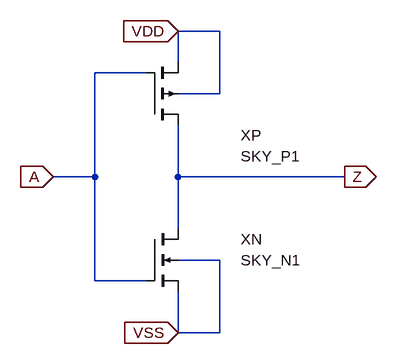
[diagram p0: schematic CMOS_INV.asc]
CMOS_INV.asc, the LTspice schematic file:
Version 4.1
SHEET 1 960 704
WIRE 352 192 352 272
WIRE 352 272 352 352
WIRE 352 272 608 272
WIRE 304 112 224 112
WIRE 224 112 224 272
WIRE 224 272 224 432
WIRE 224 432 304 432
WIRE 224 272 160 272
WIRE 352 96 352 48
WIRE 352 144 416 144
WIRE 416 144 416 48
WIRE 416 48 352 48
WIRE 352 448 352 512
WIRE 352 400 416 400
WIRE 416 400 416 512
WIRE 416 512 352 512
FLAG 608 272 Z
IOPIN 608 272 Out
FLAG 160 272 A
IOPIN 160 272 In
FLAG 352 48 VDD
IOPIN 352 48 In
FLAG 352 512 VSS
IOPIN 352 512 In
SYMBOL pmos4 304 192 M180
WINDOW 0 144 -16 Left 2
WINDOW 3 144 -48 Left 2
SYMATTR InstName XP
SYMATTR Value SKY_P1
SYMATTR SpiceLine w=1 l=0.15 mult=2
SYMATTR Prefix X
SYMBOL nmos4 304 352 R0
WINDOW 0 144 16 Left 2
WINDOW 3 144 48 Left 2
SYMATTR InstName XN
SYMATTR Value SKY_N1
SYMATTR SpiceLine w=1 l=0.15 mult=1
SYMATTR Prefix X

The netlist it stands for:
* CMOS_INV.asc
X§XP Z A VDD VDD SKY_P1 w=1 l=0.15 mult=2  ; pins D G S B
X§XN Z A VSS VSS SKY_N1 w=1 l=0.15 mult=1  ; pins D G S B
.backanno
.end